# Altium schematic sheet Power-Supply-Sheet.SchDoc (part 3 of 3)
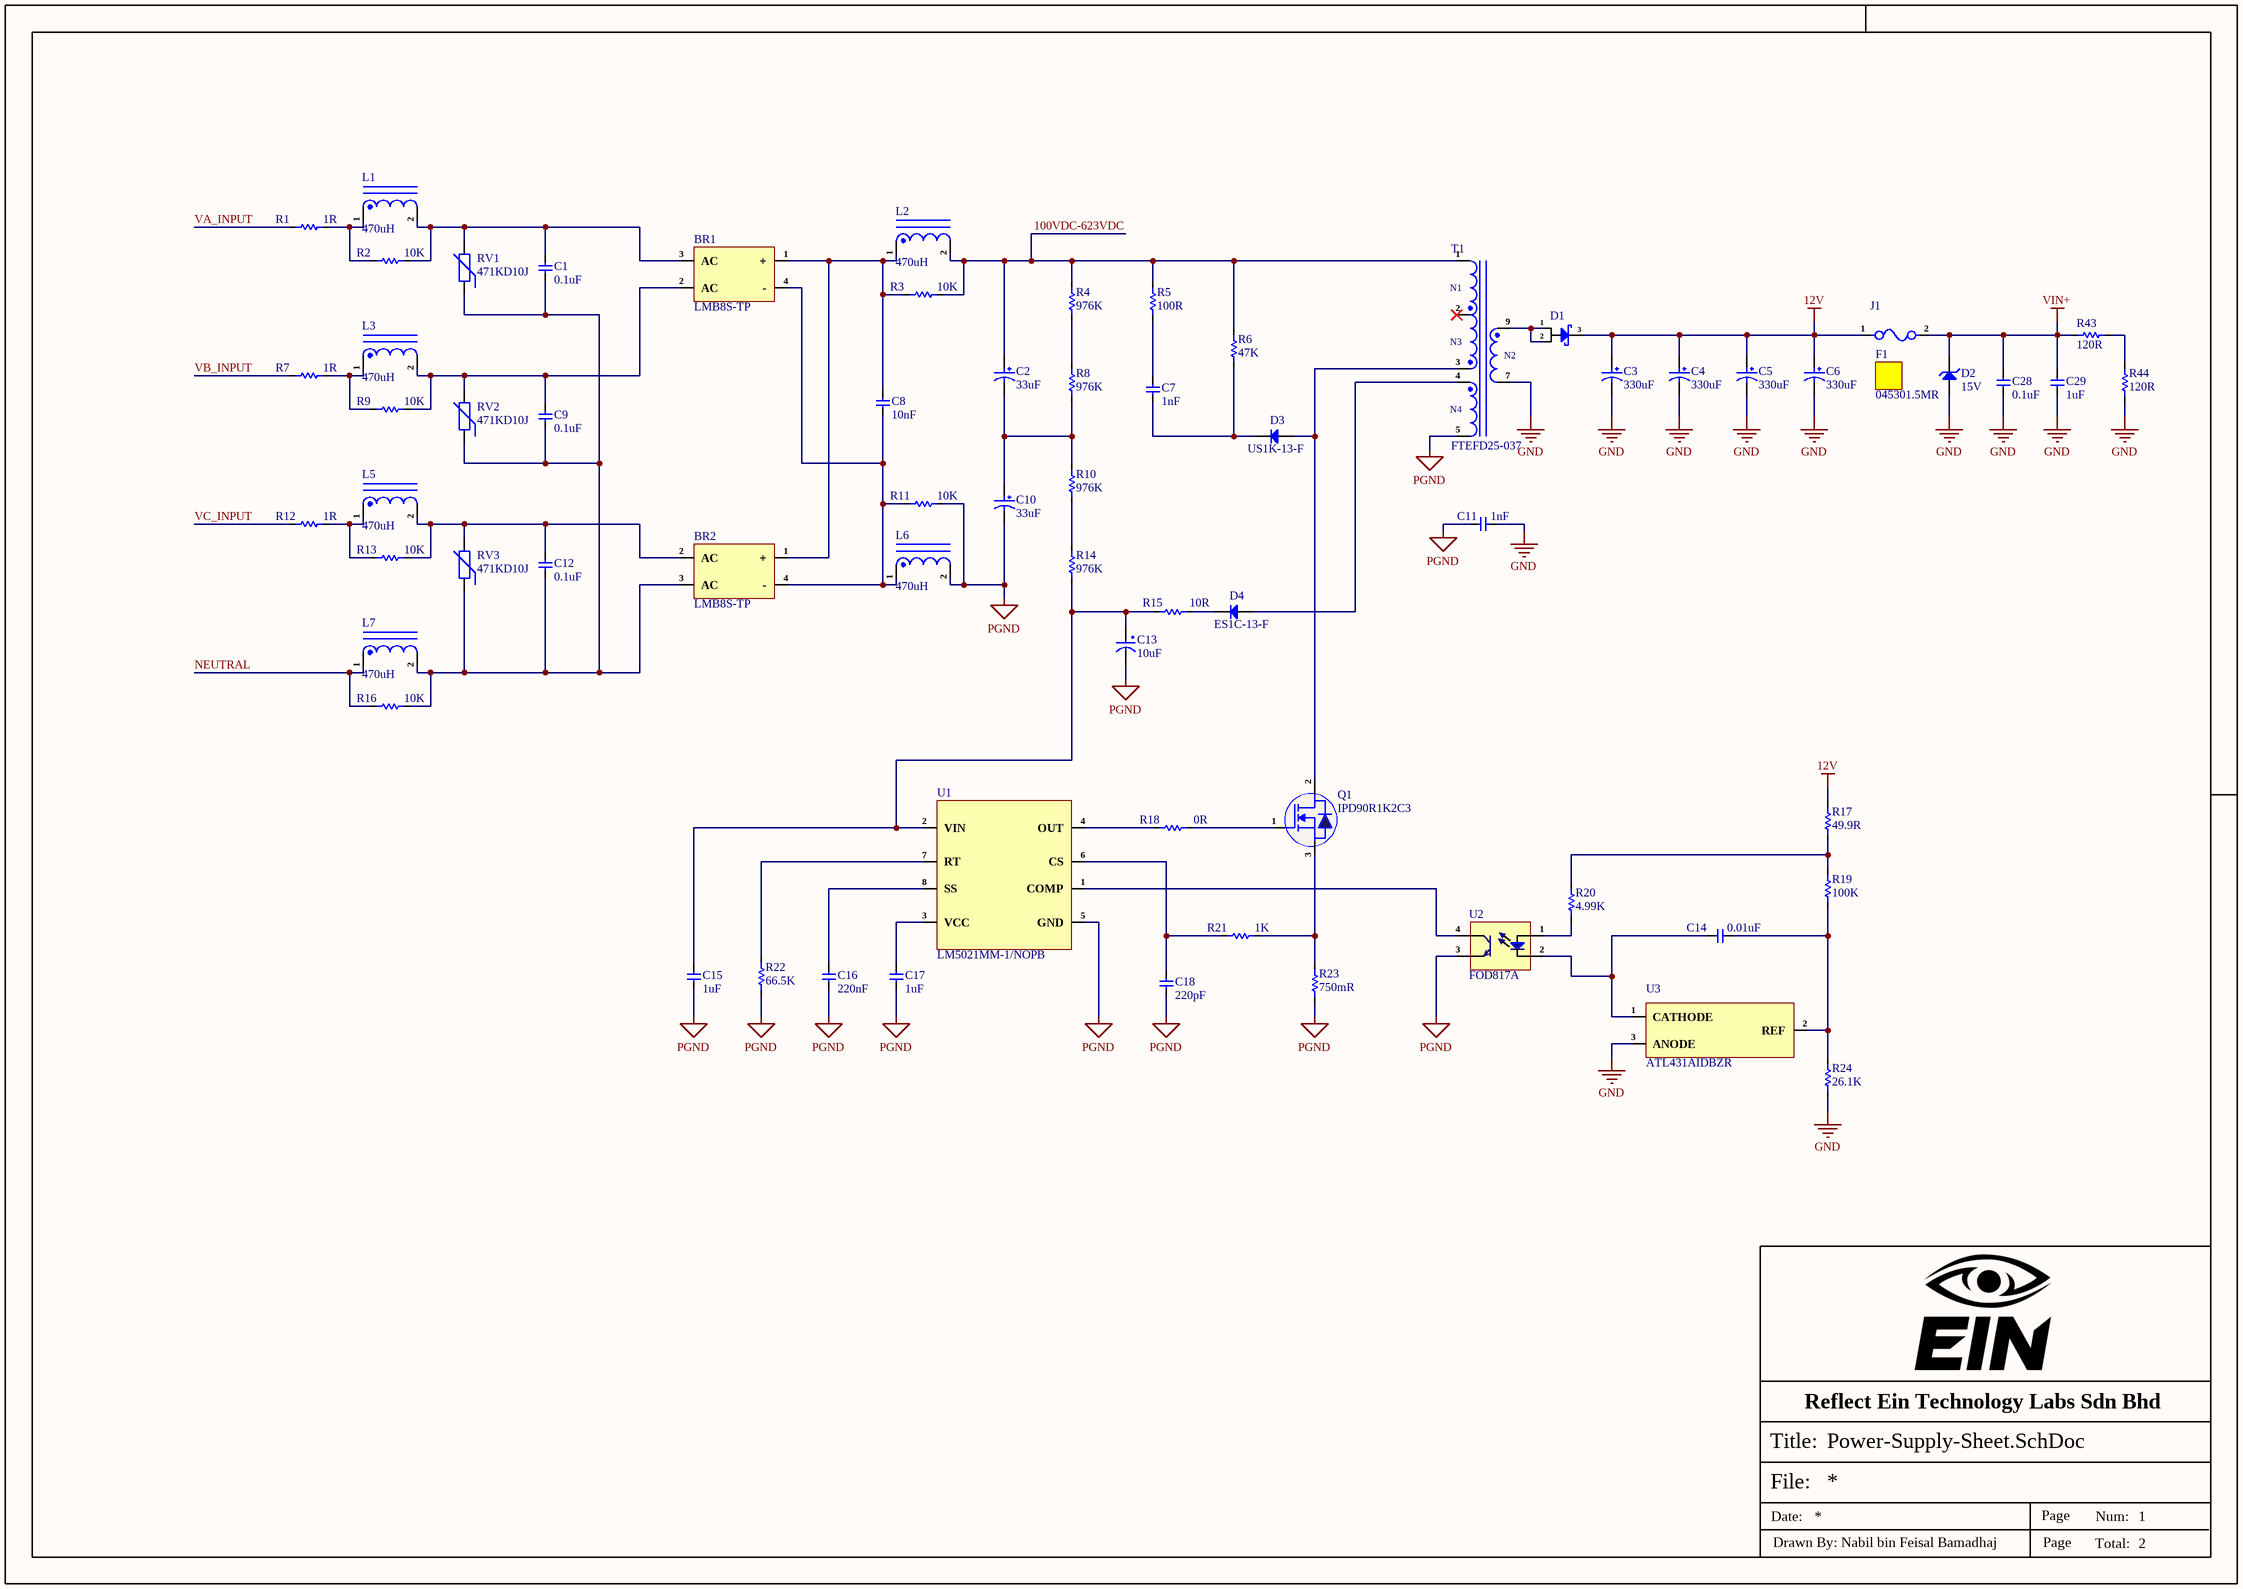
[diagram p2: Power-Supply-Sheet.SchDoc]

## Library data of the parts (continued)
U1 = LM5021MM-1/NOPB: IC OFFLINE SW MULT TOP 8VSSOP; Manufacturer: TI National Semiconductor; Frequency: 500kHz; Output Voltage: 600mV; Output Current: 100mA; Switching Frequency: 1MHz; Quiescent Current: 2.5mA; Topology: Flyback; Max Supply Voltage: 30V; Min Supply Voltage: 8V; Rise Time: 25ns; Fall Time: 10ns; Duty Cycle: 80%; Nominal Supply Voltage: 15V; Supplier: Mouser; LCSC Part Number: C202233; Manufacturer Part Number: LM5021MM-1/NOPB; RoHS: Yes; Item Type: IC; Stock: 1237; Pricing: 1=1.4, 10=1.04, 50=1.04, 100=0.968, 1000=0.887, 10000=0.856 (USD); Mounting Technology: Surface Mount; Case/Package: MSOP; Pins: 8; Min Operating Temperature: -40°C; Max Operating Temperature: 125°C; Packaging: Tape and Reel; Termination: SMD/SMT; Series: -; Thickness: 970um; Reach SVHC Compliant: No; Lead Free: Lead Free; RoHS Compliant: Yes; ComponentLink1URL: https://datasheet.ciiva.com/1513/1771307-1513330.pdf?src-supplier=Element14; ComponentLink1Description: https://datasheet.ciiva.com/1513/1771307-1513330.pdf?src-supplier=Element14; ComponentLink2URL: https://datasheet.ciiva.com/49118/1767118-49118582.pdf?src-supplier=Element14; ComponentLink2Description: https://datasheet.ciiva.com/49118/1767118-49118582.pdf?src-supplier=Element14; ComponentLink3URL: https://datasheet.ciiva.com/49118/1767118-49118263.pdf?src-supplier=Element14; ComponentLink3Description: https://datasheet.ciiva.com/49118/1767118-49118263.pdf?src-supplier=Element14; ComponentLink4URL: https://datasheet.ciiva.com/46389/1888908-46389836.pdf?src-supplier=Element14; ComponentLink4Description: https://datasheet.ciiva.com/46389/1888908-46389836.pdf?src-supplier=Element14; ComponentLink5URL: https://datasheet.ciiva.com/6613/lm5021-6613338.pdf?src-supplier=Digikey; ComponentLink5Description: https://datasheet.ciiva.com/6613/lm5021-6613338.pdf?src-supplier=Digikey; ComponentLink6URL: https://datasheet.ciiva.com/6613/lm5021-6613340.pdf?src-supplier=Digikey; ComponentLink6Description: https://datasheet.ciiva.com/6613/lm5021-6613340.pdf?src-supplier=Digikey; ComponentLink7URL: https://datasheet.ciiva.com/6613/lm5021-6613336.pdf?src-supplier=Digikey; ComponentLink7Description: https://datasheet.ciiva.com/6613/lm5021-6613336.pdf?src-supplier=Digikey
U2 = FOD817A: OPTOISOLATOR 5KV TRANSISTOR 4DIP; Manufacturer: ON Semiconductor / Fairchild; Item Type: IC; Supplier: Future Electronics; LCSC Part Number: C900909; Manufacturer Part Number: FOD817A; RoHS: Yes; Stock: 9100; Pricing: 100=0.0832, 500=0.0801, 2500=0.0771, 10000=0.0747, 25000=0.0712 (USD); ComponentLink1URL: https://datasheet.ciiva.com/25620/0900766b810e24fa-25620684.pdf?src-supplier=Rs; ComponentLink1Description: https://datasheet.ciiva.com/25620/0900766b810e24fa-25620684.pdf?src-supplier=Rs; ComponentLink2URL: https://datasheet.ciiva.com/15118/getdatasheetpartid-67083-15118459.pdf?src-supplier=Verical; ComponentLink2Description: https://datasheet.ciiva.com/15118/getdatasheetpartid-67083-15118459.pdf?src-supplier=Verical; ComponentLink3URL: https://datasheet.ciiva.com/27056/2016920-27056231.pdf?src-supplier=Jameco; ComponentLink3Description: https://datasheet.ciiva.com/27056/2016920-27056231.pdf?src-supplier=Jameco; ComponentLink4URL: https://datasheet.ciiva.com/12239/fod817a-12239227.pdf?src-supplier=Mouser; ComponentLink4Description: https://datasheet.ciiva.com/12239/fod817a-12239227.pdf?src-supplier=Mouser; ComponentLink5URL: https://datasheet.ciiva.com/8095/fod817d-8095131.pdf?src-supplier=Avnet; ComponentLink5Description: https://datasheet.ciiva.com/8095/fod817d-8095131.pdf?src-supplier=Avnet; ComponentLink6URL: https://datasheet.ciiva.com/2086/fod814a-2086034.pdf?src-supplier=Digikey; ComponentLink6Description: https://datasheet.ciiva.com/2086/fod814a-2086034.pdf?src-supplier=Digikey; ComponentLink7URL: https://datasheet.ciiva.com/16741/fod817-16741992.pdf?src-supplier=Future+Electronics; ComponentLink7Description: https://datasheet.ciiva.com/16741/fod817-16741992.pdf?src-supplier=Future+Electronics
U3 = ATL431AIDBZR: IC VREF SHUNT ADJ 1% SOT23-3; Manufacturer: Texas Instruments; Supplier: Mouser; LCSC Part Number: C134067; Manufacturer Part Number: ATL431AIDBZR; RoHS: Yes; Item Type: IC; Stock: 1938; Pricing: 1=0.41, 10=0.252, 50=0.252, 100=0.202, 1000=0.184, 10000=0.15 (USD); Length: 2.92mm; Width: 1.3mm; Height: 1.22mm; Thickness: 1mm; Lead Free: 5697LeadFree; ComponentLink1URL: http://www.ti.com/general/docs/lit/getliterature.tsp?genericPartNumber=ATL431&&fileType=pdf&src-supplier=Element14; ComponentLink1Description: http://www.ti.com/general/docs/lit/getliterature.tsp?genericPartNumber=ATL431&&fileType=pdf&src-supplier=Element14; ComponentLink2URL: http://www.ti.com/general/docs/lit/getliterature.tsp?genericPartNumber=ATL431&amp;&amp;fileType=pdf&src-supplier=Element14; ComponentLink2Description: http://www.ti.com/general/docs/lit/getliterature.tsp?genericPartNumber=ATL431&amp;&amp;fileType=pdf&src-supplier=Element14; ComponentLink3URL: http://www.ti.com/lit/ds/symlink/atl431.pdf?src-supplier=Digikey; ComponentLink3Description: http://www.ti.com/lit/ds/symlink/atl431.pdf?src-supplier=Digikey; ComponentLink4URL: http://www.ti.com/general/docs/lit/getliterature.tsp?genericPartNumber=ATL432&&fileType=pdf&src-supplier=Avnet; ComponentLink4Description: http://www.ti.com/general/docs/lit/getliterature.tsp?genericPartNumber=ATL432&&fileType=pdf&src-supplier=Avnet; ComponentLink5URL: http://www.ti.com/general/docs/lit/getliterature.tsp?genericPartNumber=ATL431&&fileType=pdf&src-supplier=Farnell; ComponentLink5Description: http://www.ti.com/general/docs/lit/getliterature.tsp?genericPartNumber=ATL431&&fileType=pdf&src-supplier=Farnell